# EasyEDA Pro project ProProject_大疆无人机PSDK开发板_2026-03-01.epro, board PSDK_STM32
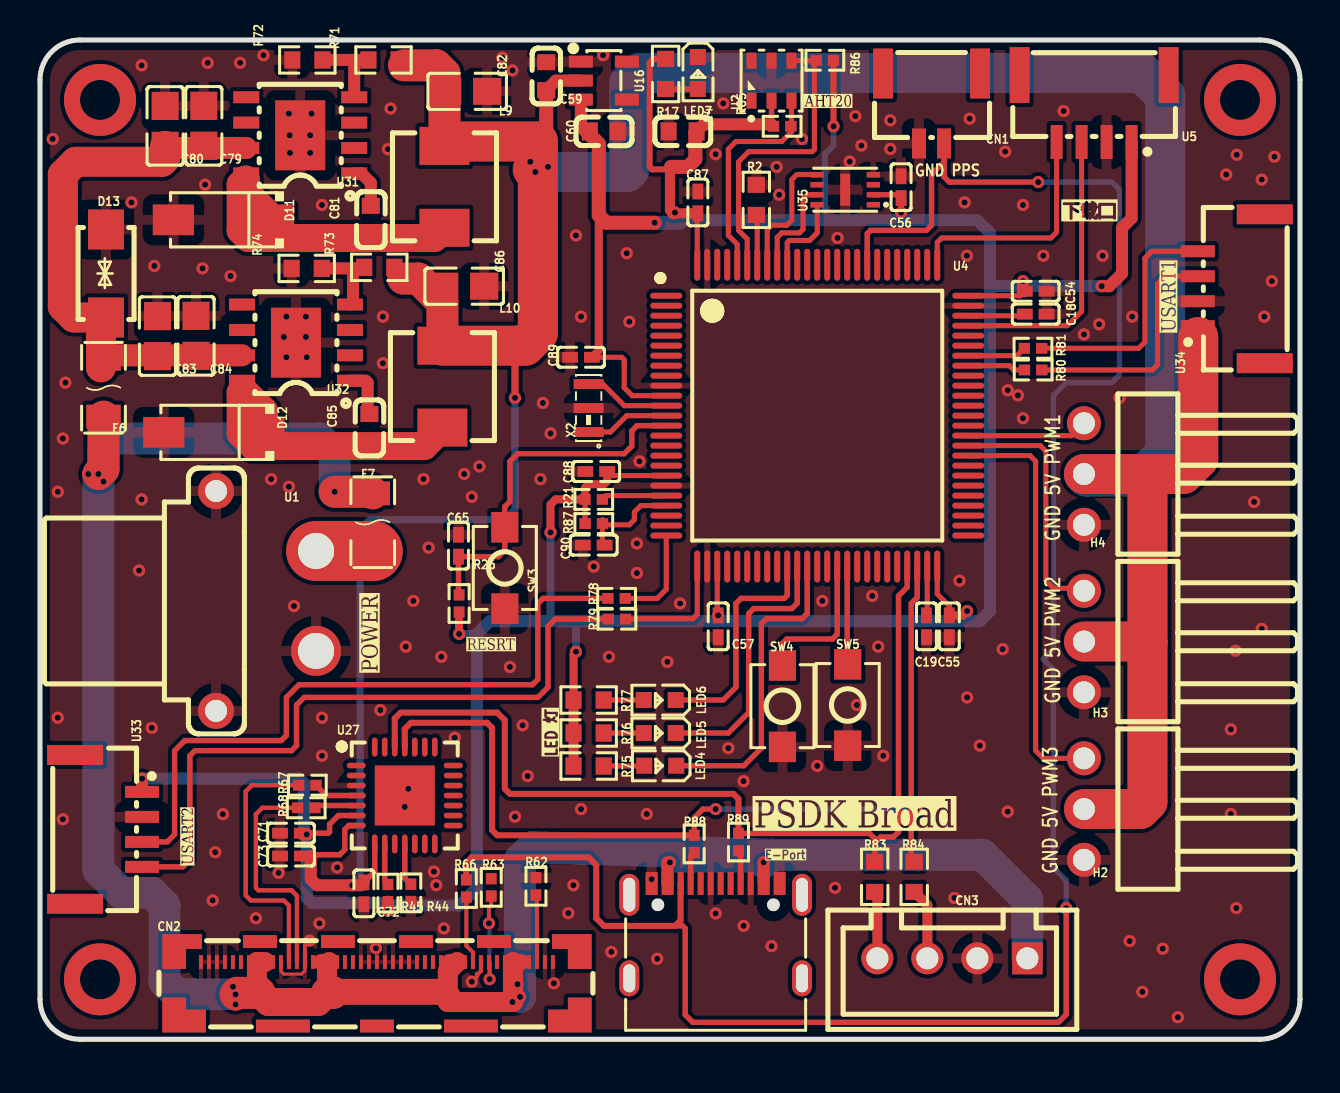
[diagram p1: board, top side]
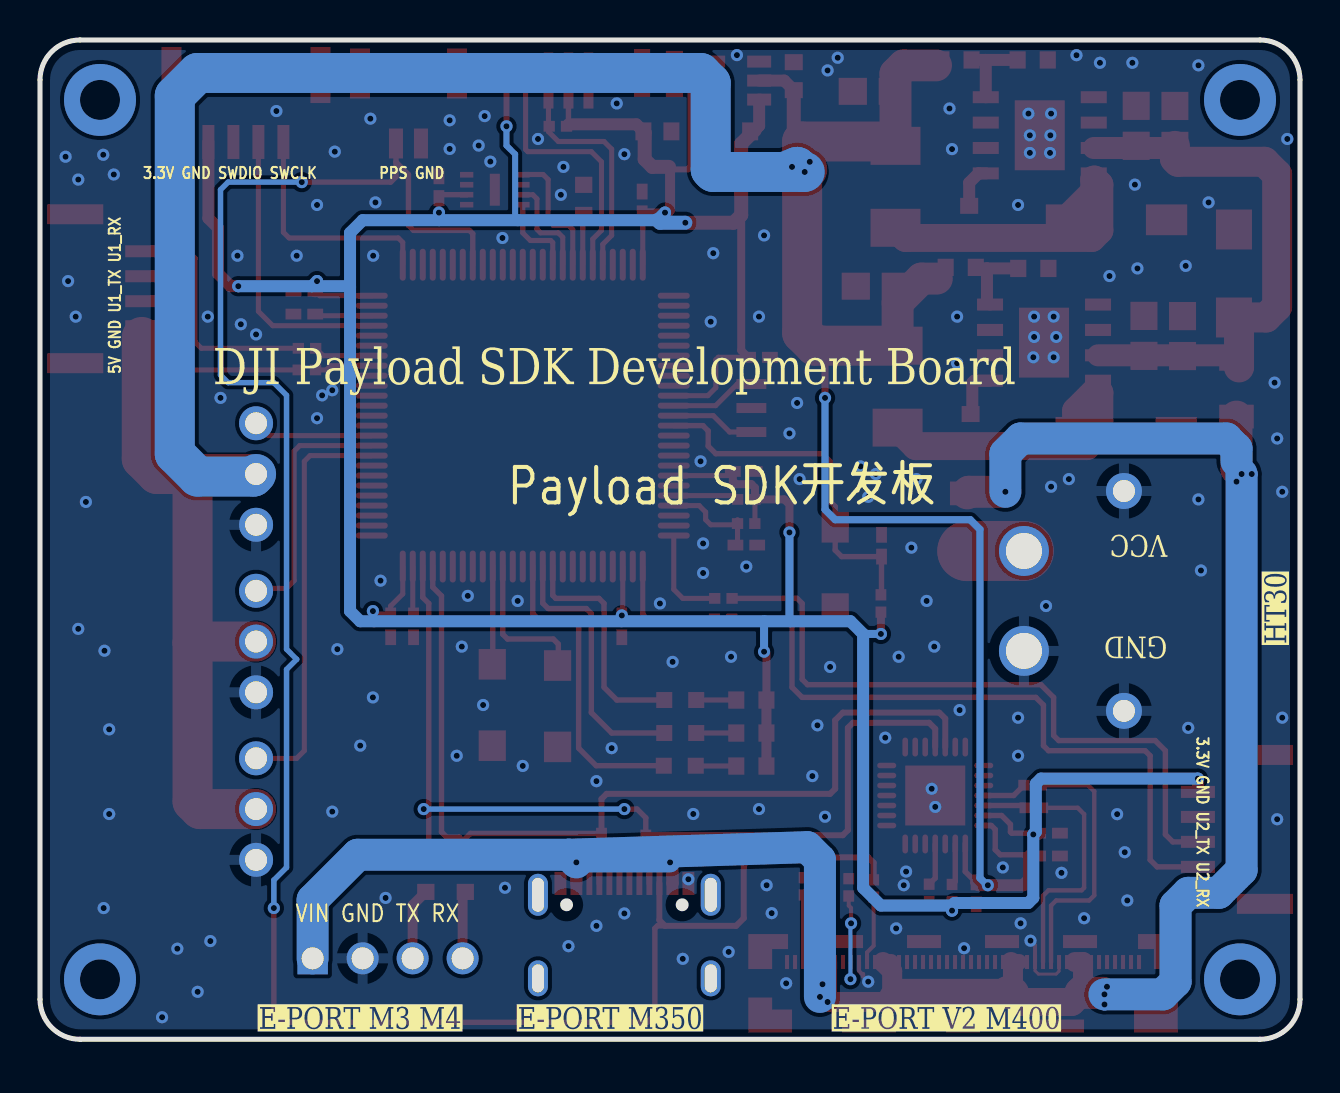
[diagram p2: board, bottom side, seen from below]

Outline 63 x 50 mm; copper layers: Top Layer, Bottom Layer. Coordinates in mm from the lower left corner of the outline.
Outline path: 0,48 0,2 arc(0.59,0.59) 2,0 61,0 arc(62.41,0.59) 63,2 63,48 arc(62.41,49.41) 61,50 2,50 arc(0.59,49.41) 0,48
Stack: Top Layer 0.035mm / Dielectric1 1.51mm FR4 er 4.5 / Bottom Layer 0.035mm

## Design rules (mm)
template: 自定义配置
spacing copperThickness1oz (default): track to track 0.102, other pairs 0.152 to 0.3
spacing copperThickness2oz: track to track 0.203, other pairs 0.152 to 0.3
track width copperThickness1oz (default): min 0.127, default 0.254, max 5
track width copperThickness2oz: min 0.203, default 0.254, max 2.54
differential pair differentialPair (default): width min 0.127, default 0.254, max 2.54; gap min 0.152, default 0.152
via viaSize (default): diameter min 0.5, default 0.61, max 10; hole min 0.3, default 0.305, max 6.3

## Placement (name value [footprint] x y rotation side)
C4  10uF  [C0603]  32.13 45.43 180 top
C18  2.2uF  [C0402]  49.78 36.28 0 top
C19  2.2uF  [C0402]  44.32 20.66 90 top
C54  100nF  [C0402]  49.78 37.43 180 top
C55  100nF  [C0402]  45.47 20.66 90 top
C56  100nF  [C0402]  43.05 42.63 270 top
C57  100nF  [C0402]  33.91 20.66 90 top
C59  100nF  [C0603]  25.31 48.19 270 top
C60  100nF  [C0603]  28.19 45.43 180 top
C65  100nF  [C0402]  20.92 24.7 270 top
C71  10uF  [C0402]  12.55 10.31 0 top
C72  10uF  [C0402]  16.19 7.3 90 top
C73  100nF  [C0402]  12.55 9.17 0 top
C79  4.7uF  [C0805]  8.19 45.7 270 top
C80  10uF  [C0805]  6.25 45.7 270 top
C81  10nF  [C0603]  16.54 41 270 top
C82  22uF  [C0805]  21.36 47.43 180 top
C83  4.7uF  [C0805]  5.87 35.18 270 top
C84  10uF  [C0805]  7.8 35.19 270 top
C85  10nF  [C0603]  16.47 30.58 270 top
C86  22uF  [C0805]  21.21 37.68 180 top
C87  100nF  [C0402]  32.89 41.87 270 top
C88  100nF  [C0402]  27.81 28.41 0 top
C89  100nF  [C0402]  27.05 34.12 0 top
C90  100nF  [C0402]  27.69 24.73 0 top
CN1  SH-GH1.25-2PLB  [CONN-SMD_2P-P1.25_SHOUHAN_1.25-2PLTDK]  44.58 46.57 180 top
CN2  DF36A-45S-0.4V(51)  [CONN-SMD_45P-P0.40_DF36A-45S-0.4V]  16.85 2.78 0 top
CN3  ZX-XH2.54-4PZZ  [CONN-TH_4P-P2.50_4PIN]  45.62 4.05 180 top
D11  SS54  [SMA_L4.4-W2.8-LS5.4-R-RD]  9.18 41 180 top
D12  SS54  [SMA_L4.4-W2.8-LS5.4-R-RD]  8.69 30.37 180 top
D13  SMAJ30CA  [SMA_L4.4-W2.8-LS5.1-BI]  3.3 38.32 270 top
E-Port  -  [PSDK-SMD]  33.78 5.42 0 top
F6  SMD1206-500-6V  [F1206]  3.17 32.6 90 top
F7  SMD1206-500-6V  [F1206]  16.64 25.87 270 top
H2  HX PZ2.54-1x3P WZ  [HDR-TH_3P-P2.54-H-M-W10.4-N]  52.2 11.52 90 top
H3  HX PZ2.54-1x3P WZ  [HDR-TH_3P-P2.54-H-M-W10.4-N]  52.2 19.9 90 top
H4  HX PZ2.54-1x3P WZ  [HDR-TH_3P-P2.54-H-M-W10.4-N]  52.2 28.28 90 top
L9  10uH  [IND-SMD_L5.4-W5.2_FXL0530]  20.22 42.65 270 top
L10  10uH  [IND-SMD_L5.4-W5.2_FXL0530]  20.12 32.65 270 top
LED4  LTST-C190KSKT  [LED0603-RD]  31.01 13.69 180 top
LED5  LTST-C190KSKT  [LED0603-RD]  30.99 15.33 180 top
LED6  LTST-C190KSKT  [LED0603-RD]  30.99 16.98 180 top
LED7  LTST-C190KSKT  [LED0603-RD]  32.89 48.35 270 top
R2  10kΩ  [R0603]  35.81 42 90 top
R17  510Ω  [R0603]  31.28 48.3 270 top
R21  10kΩ  [R0402]  27.69 27.01 0 top
R26  10kΩ  [R0402]  20.96 21.81 270 top
R44  4.7kΩ  [R0402]  18.54 7.33 90 top
R45  4.7kΩ  [R0402]  17.4 7.31 90 top
R62  0Ω  [R0402]  24.8 7.66 270 top
R63  0Ω  [R0402]  22.56 7.6 270 top
R66  0Ω  [R0402]  21.32 7.54 270 top
R67  22Ω  [R0402]  13.37 12.71 180 top
R68  22Ω  [R0402]  13.31 11.58 180 top
R71  10kΩ  [R0603]  17.18 49 0 top
R72  3.24kΩ  [R0603]  13.37 49 0 top
R73  10kΩ  [R0603]  16.96 38.62 0 top
R74  3.24kΩ  [R0603]  13.34 38.57 0 top
R75  1kΩ  [R0603]  27.43 13.67 0 top
R76  1kΩ  [R0603]  27.43 15.33 0 top
R77  1kΩ  [R0603]  27.43 16.98 0 top
R78  22Ω  [R0402]  28.83 22.06 180 top
R79  22Ω  [R0402]  28.85 21.02 180 top
R80  22Ω  [R0402]  49.66 33.49 0 top
R81  22Ω  [R0402]  49.65 34.57 0 top
R83  22Ω  [R0603]  41.74 8.13 270 top
R84  22Ω  [R0603]  43.71 8.13 270 top
R85  10kΩ  [R0402]  37.11 45.68 180 top
R86  10kΩ  [R0402]  39.24 48.98 0 top
R87  0Ω  [R0402]  27.69 25.8 0 top
R88  22Ω  [R0402]  32.71 9.78 90 top
R89  22Ω  [R0402]  34.93 9.87 90 top
SW3  HX 3x4x2-2P-2.5N  [SW-SMD_L4.0-W2.9-LS5.0]  23.24 23.58 90 top
SW4  HX 3x4x2-2P-2.5N  [SW-SMD_L4.0-W2.9-LS5.0]  37.12 16.67 90 top
SW5  HX 3x4x2-2P-2.5N  [SW-SMD_L4.0-W2.9-LS5.0]  40.39 16.73 90 top
U1  XT30PW-F  [CONN-TH_XT30PW-F]  11.3 21.93 270 top
U2  AHT20  [SENSOR-SMD_L3.0-W3.0-P1.00-BR]  36.58 47.97 270 top
U4  STM32F407VGT6  [LQFP-100_L14.0-W14.0-P0.50-LS16.0-BL]  38.86 31.2 270 top
U5  WAFER-GH1.25-4PLB  [CONN-SMD_4P-P1.25_XUNPU_WAFER-GH1.25-4PLB]  52.71 46.57 180 top
U16  TPTLV70433DBVR  [SOT-23-5_L3.0-W1.6-P0.95-LS2.8-BR]  28.19 47.97 180 top
U27  CP2102-GM  [qfn-28_l5.0-w5.0-p0.50-tl-ep3.2]  18.24 12.2 0 top
U31  TPS5430DDAR  [ESOP-8_L4.9-W3.9-P1.27-LS6.0-TL-EP]  13.01 45.23 180 top
U32  TPS5430DDAR  [ESOP-8_L4.9-W3.9-P1.27-LS6.0-TL-EP]  12.8 34.86 180 top
U33  WAFER-GH1.25-4PLB  [CONN-SMD_4P-P1.25_XUNPU_WAFER-GH1.25-4PLB]  3.43 10.5 270 top
U34  WAFER-GH1.25-4PLB  [CONN-SMD_4P-P1.25_XUNPU_WAFER-GH1.25-4PLB]  59.56 37.55 90 top
U35  DJI_SDKCC  [dfn-8_l3.0-w2.0-p0.50-bl-ep]  40.26 42.51 90 top
X2  8MHz  [OSC-SMD_3P-L3.2-W1.3-P1.20]  27.43 31.58 90 top

## Footprints (pads in the part's own frame, mm; a bottom-side part is the same pattern mirrored in y, then rotated)
C0402
  rect 0.79x0.54 smd: 1(-0.545,0) 2(0.545,0)
C0603
  rect 0.8x0.9 smd: 1(-0.7,0) 2(0.7,0)
C0805
  rect 1.41x1.35 smd: 1(-1,0) 2(1,0)
CONN-SMD_2P-P1.25_SHOUHAN_1.25-2PLTDK
  rect 0.7x1.5 smd: 1(-0.625,1.75) 2(0.625,1.75)
  rect 1x2.5 smd: 3(2.425,-1.75) 4(-2.425,-1.75)
CONN-SMD_4P-P1.25_XUNPU_WAFER-GH1.25-4PLB
  rect 0.6x1.7 smd: 1(-1.875,1.675) 2(-0.625,1.675) 3(0.625,1.675) 4(1.875,1.675)
  rect 1x2.8 smd: 5(-3.725,-1.675) 6(3.725,-1.675)
CONN-SMD_45P-P0.40_DF36A-45S-0.4V
  rect 0.2x0.7 smd: 1(-8.8,1.089) 2(-8.4,1.089) 3(-8,1.089) 4(-7.6,1.089) 5(-7.2,1.089) 6(-6.8,1.089) 7(-6.4,1.089) 8(-6,1.089) 9(-5.6,1.089) 10(-5.2,1.089) 11(-4.8,1.089) 12(-4.4,1.089) 13(-4,1.089) 14(-3.6,1.089) 15(-3.2,1.089) 16(-2.8,1.089) 17(-2.4,1.089) 18(-2,1.089) 19(-1.6,1.089) 20(-1.2,1.089) 21(-0.8,1.089) 22(-0.4,1.089) 23(0,1.089) 24(0.4,1.089) 25(0.8,1.089) 26(1.2,1.089) 27(1.6,1.089) 28(2,1.089) 29(2.4,1.089) 30(2.8,1.089) 31(3.2,1.089) 32(3.6,1.089) 33(4,1.089) 34(4.4,1.089) 35(4.8,1.089) 36(5.2,1.089) 37(5.6,1.089) 38(6,1.089) 39(6.4,1.089) 40(6.8,1.089) 41(7.2,1.089) 42(7.6,1.089) 43(8,1.089) 44(8.4,1.089) 45(8.8,1.089)
  custom 1.985x1.75 smd: 46(-9.742,1.613) 51(9.742,1.613)
  rect 1.7x0.65 smd: 47(-5.85,2.114) 48(-1.95,2.114) 49(1.95,2.114) 50(5.85,2.114) 54(0,-2.114)
  custom 2.185x1.75 smd: 52(9.643,-1.563) 56(-9.643,-1.563)
  rect 2.7x0.65 smd: 53(4.7,-2.114) 55(-4.7,-2.114)
CONN-TH_4P-P2.50_4PIN
  rect 1.524x1.6 hole 1.1: 1(-3.75,0)
  round 1.6 hole 1.1: 2(-1.25,0) 3(1.25,0) 4(3.75,0)
CONN-TH_XT30PW-F
  round 2.5 hole 1.8: 1(-2.5,2.5) 2(2.5,2.5)
  round 1.8 hole 1.1: 3(5.5,-2.5) 4(-5.5,-2.5)
dfn-8_l3.0-w2.0-p0.50-bl-ep
  rect 0.28x0.665 smd: 1(-0.75,-1.407) 2(-0.25,-1.407) 3(0.25,-1.407) 4(0.75,-1.407) 5(0.75,1.407) 6(0.25,1.407) 7(-0.25,1.407) 8(-0.75,1.407)
  rect 1.6x0.5 smd: 9(0,0)
ESOP-8_L4.9-W3.9-P1.27-LS6.0-TL-EP
  rect 1.3x0.6 smd: 1(-2.7,1.905) 2(-2.7,0.635) 3(-2.7,-0.635) 4(-2.7,-1.905) 5(2.7,-1.905) 6(2.7,-0.635) 7(2.7,0.635) 8(2.7,1.905)
  rect 2.5x3.5 smd: 9(0,0)
F1206
  rect 1.19x1.728 smd: 1(-1.445,0) 2(1.445,0)
HDR-TH_3P-P2.54-H-M-W10.4-N
  round 1.7 hole 1.1: 1(-2.54,0) 2(0,0) 3(2.54,0)
IND-SMD_L5.4-W5.2_FXL0530
  rect 1.9x2.5 smd: 1(-2.05,0) 2(2.05,0)
LED0603-RD
  rect 0.8x0.8 smd: 1(-0.799,0) 2(0.799,0)
LQFP-100_L14.0-W14.0-P0.50-LS16.0-BL
  oval 0.3x1.6 smd: 1(-6,-7.55) 2(-5.5,-7.55) 3(-5,-7.55) 4(-4.5,-7.55) 5(-4,-7.55) 6(-3.5,-7.55) 7(-3,-7.55) 8(-2.5,-7.55) 9(-2,-7.55) 10(-1.5,-7.55) 11(-1,-7.55) 12(-0.5,-7.55) 13(0,-7.55) 14(0.5,-7.55) 15(1,-7.55) 16(1.5,-7.55) 17(2,-7.55) 18(2.5,-7.55) 19(3,-7.55) 20(3.5,-7.55) 21(4,-7.55) 22(4.5,-7.55) 23(5,-7.55) 24(5.5,-7.55) 25(6,-7.55) 51(6,7.55) 52(5.5,7.55) 53(5,7.55) 54(4.5,7.55) 55(4,7.55) 56(3.5,7.55) 57(3,7.55) 58(2.5,7.55) 59(2,7.55) 60(1.5,7.55) 61(1,7.55) 62(0.5,7.55) 63(0,7.55) 64(-0.5,7.55) 65(-1,7.55) 66(-1.5,7.55) 67(-2,7.55) 68(-2.5,7.55) 69(-3,7.55) 70(-3.5,7.55) 71(-4,7.55) 72(-4.5,7.55) 73(-5,7.55) 74(-5.5,7.55) 75(-6,7.55)
  oval 1.6x0.3 smd: 26(7.55,-6) 27(7.55,-5.5) 28(7.55,-5) 29(7.55,-4.5) 30(7.55,-4) 31(7.55,-3.5) 32(7.55,-3) 33(7.55,-2.5) 34(7.55,-2) 35(7.55,-1.5) 36(7.55,-1) 37(7.55,-0.5) 38(7.55,0) 39(7.55,0.5) 40(7.55,1) 41(7.55,1.5) 42(7.55,2) 43(7.55,2.5) 44(7.55,3) 45(7.55,3.5) 46(7.55,4) 47(7.55,4.5) 48(7.55,5) 49(7.55,5.5) 50(7.55,6) 76(-7.55,6) 77(-7.55,5.5) 78(-7.55,5) 79(-7.55,4.5) 80(-7.55,4) 81(-7.55,3.5) 82(-7.55,3) 83(-7.55,2.5) 84(-7.55,2) 85(-7.55,1.5) 86(-7.55,1) 87(-7.55,0.5) 88(-7.55,0) 89(-7.55,-0.5) 90(-7.55,-1) 91(-7.55,-1.5) 92(-7.55,-2) 93(-7.55,-2.5) 94(-7.55,-3) 95(-7.55,-3.5) 96(-7.55,-4) 97(-7.55,-4.5) 98(-7.55,-5) 99(-7.55,-5.5) 100(-7.55,-6)
OSC-SMD_3P-L3.2-W1.3-P1.20
  rect 0.5x1.5 smd: 1(-1.2,0) 2(0,0) 3(1.2,0)
PSDK-SMD
  oval 1x2.1 hole 0.6x1.7: 1(-4.32,1.808) 2(4.32,1.808)
  oval 1x1.8 hole 0.6x1.4: 3(-4.32,-2.373) 4(4.32,-2.373)
  rect 0.6x1.15 smd: A1B12(-3.2,2.373) A4B9(-2.4,2.373) A9B4(2.4,2.373) A12B1(3.2,2.373)
  rect 0.3x1.15 smd: A5(-1.75,2.373) A6(-0.25,2.373) A7(0.75,2.373) A8(1.75,2.373) B5(1.25,2.373) B6(0.25,2.373) B7(-0.75,2.373) B8(-1.25,2.373)
qfn-28_l5.0-w5.0-p0.50-tl-ep3.2
  oval 0.95x0.28 smd: 1(-2.425,1.502) 2(-2.425,1.001) 3(-2.425,0.5) 4(-2.425,0) 5(-2.425,-0.5) 6(-2.425,-1) 7(-2.425,-1.501) 15(2.425,-1.501) 16(2.425,-1) 17(2.425,-0.5) 18(2.425,0) 19(2.425,0.5) 20(2.425,1.001) 21(2.425,1.502)
  oval 0.28x0.95 smd: 8(-1.502,-2.425) 9(-1.001,-2.425) 10(-0.5,-2.425) 11(0,-2.425) 12(0.5,-2.425) 13(1,-2.425) 14(1.501,-2.425) 22(1.501,2.425) 23(1,2.425) 24(0.5,2.425) 25(0,2.425) 26(-0.5,2.425) 27(-1.001,2.425) 28(-1.502,2.425)
  rect 3x3 smd: 29(0,0)
R0402
  rect 0.566x0.54 smd: 1(-0.433,0) 2(0.433,0)
R0603
  rect 0.806x0.864 smd: 1(-0.753,0) 2(0.753,0)
SENSOR-SMD_L3.0-W3.0-P1.00-BR
  rect 0.8x0.5 smd: 1(1,-1) 2(1,0) 3(1,1) 4(-1,1) 5(-1,0) 6(-1,-1)
SMA_L4.4-W2.8-LS5.1-BI
  rect 2x1.8 smd: 1(-2.2,0) 2(2.2,0)
SMA_L4.4-W2.8-LS5.4-R-RD
  rect 2.062x1.539 smd: 1(2.503,0) 2(-2.503,0)
SOT-23-5_L3.0-W1.6-P0.95-LS2.8-BR
  rect 1.2x0.6 smd: 1(1.15,-0.95) 2(1.15,0) 3(1.15,0.95) 4(-1.15,0.95) 5(-1.15,-0.95)
SW-SMD_L4.0-W2.9-LS5.0
  rect 1.53x1.36 smd: 1(-2.035,0) 2(2.035,0)

## Nets
As in the schematic.

Pads without a net: CN1 3 4; CN2 5 6 19 20 29 30 38 46 47 48 49 50 51 52 53 54 55 56; E-Port 1 2 3 4; U2 1 6; U4 1 2 3 4 5 6 7 8 9 15 16 17 18 23 24 29 30 31 32 33 34 38 39 42 43 44 45 46 51 52 53 54 55 56 57 58 62 63 64 65 66 67 70 71 77 78 79 80 81 82 84 85 86 87 88 89 90 97 98; U5 5 6; U16 4 5; U27 1 2 10 12 13 14 15 16 17 18 19 20 21 22 23 24 27 28; U31 2 3 5; U32 2 3 5; U33 5 6; U34 5 6; U35 1 3 6

## Via types
v1: diameter 3.6, hole 2, Top Layer to Bottom Layer, 4 vias
v2: diameter 0.61, hole 0.305, Top Layer to Bottom Layer, 191 vias

## Routing (per net, layer and track width the routed paths; a pad name or vN(x,y) marks a point on that pad's centre or on a via; arc(x,y) is an arc through that point)
3.3V: length 205.3
  Top Layer w0.254: U4.19 28.44,28.2 28.36,28.28 ; C54.2 49.02,37.2 U4.75 ; C55.2 45.47,21.68 44.86,22.28 U4.50 ; v2(33.91,21.21) 33.86,21.25 U4.28 ; C89.2 29.08,34.12 29.21,34 29.21,32.6 29.61,32.2 U4.11 ; U4.100 32.86,41.3 C87.2 ; R21.1 27.25,25.81 R87.1
  Top Layer w0.27: v2(43.05,41.36) C56.2 42.88,42.26 U35.2 ; C71.2 14.42,10.31 14.48,10.38 14.48,10.76 14.92,11.2 U27.6 ; R85.2 36.58,45.78 U2.2
  Top Layer w0.3: 31.5,43.59 31.42,43.52 30.61,43.52 30.48,43.65 30.48,48.86 30.68,49.05 R17.1 ; R86.2 v2(39.68,45.68)
  Top Layer w0.4: C89.2 27.94,34.47 27.94,41.24 ; v2(46.35,21.42) 46.14,21.21 C55.2 ; R26.2 v2(20.96,20.28) ; v2(26.8,19.39) 26.68,19.27 R77.1 ; C88.2 28.36,27.94 28.19,27.78 27.43,27.78 27.25,27.6 R21.1 25.78,27.01 25.53,26.76 v2(25.53,25.36)
  Top Layer w0.5: C87.2 31.66,41.33 31.5,41.49 31.5,43.59 31.55,43.65 ; R77.1 R76.1 R75.1
  Top Layer w0.6: C71.2 13.16,10.25 v2(13.34,10.25) ; v2(49.15,37.94) 49.15,37.52 C54.2 ; U5.1 54.58,41.08 54.1,40.6 54.1,38.32 53.47,37.68 v2(53.09,37.68) ; U16.3 27.04,45.7 27.27,45.48 ; R45.1 17.4,6.88 v2(17.4,6.44) ; C4.1 33.18,45.78 36.58,45.78 ; v2(31.75,41.36) 31.7,41.36 31.66,41.33 ; U33.1 v2(5.1,13.04)
  Top Layer w0.7: C4.1 32.77,45.36 32.77,44.03 32.38,43.65 31.55,43.65 ; 27.27,45.48 27.94,44.81 27.94,41.24 28.32,40.86 v2(30.73,40.86)
  Bottom Layer w0.27: v2(43.05,41.36) 43.05,40.99 43.04,40.98
  Bottom Layer w0.3: v2(39.68,45.68) 39.68,44.72 39.24,44.28 39.24,41.11 39.11,40.98
  Bottom Layer w0.4: 25.48,20.92 25.53,20.96 v2(25.53,25.36) ; v2(33.91,21.21) 33.92,21.2 33.92,20.92 ; v2(20.96,20.28) 21.84,20.28 ; 46.3,20.92 46.35,20.98 v2(46.35,21.42) ; v2(26.8,19.39) 26.8,20.91 26.79,20.92
  Bottom Layer w0.6: 47.5,37.65 47.5,40.35 46.86,40.98 32.13,40.98 v2(31.75,41.36) ; 47.5,37.65 47.53,37.68 49.4,37.68 ; 47.5,37.65 47.5,21.42 46.99,20.92 22.48,20.92 21.84,20.28 21.84,7.58 20.96,6.69 17.4,6.69 ; v2(53.09,37.68) 49.4,37.68 ; 49.4,37.68 v2(49.15,37.94) ; 17.4,6.69 v2(17.4,6.44) ; 17.4,6.69 17.27,6.82 13.59,6.82 13.34,7.07 v2(13.34,10.25) 13.21,10.38 13.21,12.79 12.95,13.04 v2(5.1,13.04)
  Bottom Layer w0.7: 32.13,40.98 32,40.86 v2(30.73,40.86)
5V: length 174.4
  Top Layer w0.27: C72.2 16.74,8.39 U27.8 ; U27.7 15.43,10.7 15.24,10.5 15.24,9.49 14.99,9.23 13.82,9.23 13.76,9.17 C73.2
  Top Layer w0.36: v2(23.75,32.09) 23.75,34.61 23.85,34.7
  Top Layer w0.6: U16.2 25.79,47.97 C59.2 ; C72.2 16.06,7.71 v2(15.61,7.71) 13.84,7.71 13.54,8.01 13.54,9.17
  Top Layer w0.7: C59.2 25.31,45.34 24.89,44.92 ; 20.44,44.92 L9.1
  Top Layer w1.6: L10.1 20.12,36.86 18.92,38.06 18.16,38.06 ; L9.1 20.22,48.32 19.81,48.73 18.2,48.73
  Top Layer w2: 55.37,19.85 55.37,28.03 55.12,28.28 ; 55.37,19.85 55.32,19.9 H3.2 ; 55.37,19.85 55.37,11.9 54.99,11.52 H2.2 ; 55.12,28.28 57.15,28.28 57.91,29.05 57.91,35.14 ; 55.12,28.28 H4.2 ; 20.44,44.92 24.89,44.92 24.89,43.52 ; 24.89,43.52 24.89,35.34 24.26,34.7 L10.1 ; 24.89,43.52 24.64,43.52
  Bottom Layer w0.36: 15.62,7.71 15.64,7.71 16,8.07 16,25.51 16.49,26 23.24,26 23.75,26.5 v2(23.75,32.09)
  Bottom Layer w2: H4.2 52.32,28.16 55.12,28.16 56.26,29.3 56.26,47.21 55.12,48.35 29.97,48.35 29.46,47.84 29.46,43.52 29.34,43.4 25.78,43.4 ; 25.78,43.4 25.15,43.65 24.89,43.4 ; 25.78,43.4 24.89,43.4 ; v2(24.76,43.4) 24.89,43.4
  vias: v2(24.51,43.9) v2(25.4,43.65)
GND: length 4.6
  Top Layer w0.15: CN2.11 12.05,3.41 12.19,3.26 13.08,3.26 13.25,3.43 CN2.14
  Top Layer w0.2: CN2.36 22.05,3.42 21.9,3.26 21.84,3.26 21.84,3.14 v2(21.59,2.88) ; v2(13.47,4.94) 13.25,4.71 CN2.14
  vias: v2(0.64,45.05) v2(0.89,27.39) v2(0.89,16.09) v2(1.14,30.06) v2(1.14,11.01) v2(1.27,32.86) v2(4.57,41.87) v2(4.95,23.46) v2(5.08,48.73) v2(5.08,27.01) v2(5.59,15.58) v2(5.72,38.7) v2(8.13,38.57) v2(8.25,42.76) v2(8.38,48.86) v2(8.64,6.95) v2(8.76,9.36) v2(9.14,11.27) v2(9.53,38.19) v2(10,48.86) v2(10.79,6.06) v2(11.18,49.24) v2(11.56,28.03) v2(11.93,8.33) v2(12.19,35.14) v2(12.32,36.16) v2(12.32,34.12) v2(12.45,46.32) v2(12.45,27.65) v2(12.48,45.23) v2(12.5,44.35) v2(12.7,21.68) v2(13.29,36.16) v2(13.29,35.14) v2(13.34,34.12) v2(13.51,45.23) v2(13.51,44.35) v2(13.58,46.32) v2(13.97,5.8) v2(14.1,41.75) v2(14.1,16.09) v2(14.1,14.19) v2(14.86,8.6) v2(16.8,4.56) v2(17.02,16.47) v2(17.15,36.16) v2(17.15,33.83) v2(17.4,44.54) v2(17.53,46.57) v2(18.24,11.63) v2(18.29,19.65) v2(18.41,12.53) v2(18.67,21.93) v2(19.18,28.03) v2(19.43,24.6) v2(19.7,8.39) v2(19.81,7.71) v2(20.07,19.14) v2(20.19,5.55) v2(20.74,15.09) v2(21.21,28.28) v2(21.59,27.14) v2(21.97,28.66) v2(23.11,49.11) v2(23.5,18.63) v2(23.62,48.48) v2(23.75,11.14) v2(24.13,15.71) v2(24.38,13.17) v2(25.02,28.03) v2(25.15,31.84) v2(25.53,30.31) v2(25.69,2.8) v2(26.42,6.31) v2(26.67,7.71) v2(26.8,40.22) v2(27.05,36.16) v2(27.05,11.52) v2(27.69,23.65) v2(28.15,49.24) v2(28.45,19.14) v2(28.57,4.37) v2(29.34,39.33) v2(29.46,35.9) v2(29.84,24.81) v2(29.84,23.33) v2(29.97,28.92) v2(30.34,11.27) v2(30.58,8.01) v2(30.86,4.03) v2(31.37,18.89) v2(32,21.81) v2(33.78,44.28) v2(33.78,6.3) v2(34.16,46.83) v2(34.42,14.57) v2(35.18,12.92) v2(35.18,5.68) v2(36.58,4.66) v2(36.83,43.65) v2(36.96,42.25) v2(38.1,45.05) v2(38.86,13.68) v2(39.12,21.93) v2(39.75,7.58) v2(39.88,40.09) v2(40.48,43.92) v2(40.77,46.19) v2(40.84,16.73) v2(41.07,44.72) v2(41.61,22.19) v2(41.91,19.65) v2(42.16,14.19) v2(42.52,45.98) v2(42.52,44.55) v2(45.72,7.07) v2(45.97,22.95) v2(46.23,41.87) v2(46.34,39.2) v2(46.35,17.11) v2(46.48,46.06) v2(46.99,14.69) v2(48.13,19.52) v2(48.26,44.41) v2(48.39,32.47) v2(48.39,11.39) v2(48.9,32.22) v2(49.15,41.75) v2(49.15,31.08) v2(50.16,39.2) v2(51.18,46.44) v2(52.2,35.27) v2(52.96,35.78) v2(53.13,39.2) v2(53.97,32.09) v2(54.48,4.92) v2(54.61,36.16) v2(55.12,2.38) v2(56.13,4.53) v2(56.9,1.1) v2(59.31,43.27) v2(59.54,15.51) v2(59.54,11.27) v2(59.84,44.26) v2(59.78,19.44) v2(59.82,6.57) v2(60.71,26.89) v2(61.09,43.02) v2(61.09,20.54) v2(61.21,36.16) v2(61.59,37.94) v2(61.72,44.16)
VCC: length 119
  Top Layer w0.6: v2(31.5,8.85) 31.37,8.85 31.37,7.81 E-Port.A4B9 ; E-Port.A9B4 v2(36.18,8.85)
  Top Layer w0.8: CN2.16 CN2.17 ; CN2.32 CN2.33 ; CN2.40 CN2.41
  Top Layer w1: CN2.17 14.35,3.77 14.35,2.21 ; 10.85,2.45 CN2.8 CN2.9 ; 14.35,2.21 14.35,2.12 ; 14.35,2.21 14.17,2.15 ; 14.35,2.21 14.66,2.32 ; CN2.33 20.39,3.41 20.39,1.87 23.65,1.87 CN2.40
  Top Layer w1.3: 14.6,2.38 20.15,2.38 20.39,2.13
  Top Layer w1.4: 10.97,2.32 11.43,1.87 13.89,1.87 14.35,2.32
  Top Layer w1.6: v2(14.73,27.39) 16.56,27.39 F7.1 ; v2(9.78,2.25) 9.86,2.32 10.97,2.32 10.85,2.45 ; 14.6,2.38 14.66,2.32 14.35,2.32 ; F6.1 3.17,28.54 v2(2.92,28.28)
  Bottom Layer w1: v2(36.18,8.85) v2(31.5,8.85)
  Bottom Layer w1.6: v2(9.78,2.25) 6.86,2.25 6.22,2.88 6.22,6.69 5.59,7.33 4.06,7.33 2.92,8.47 v2(2.92,28.28) ; 36.58,9.23 24.64,9.61 24,8.98 v2(24,2.12) ; 36.58,9.23 36.56,9.23 v2(36.18,8.85) ; 36.58,9.23 47.12,9.23 49.37,6.98 CN3.1 ; v2(14.73,27.39) 14.73,29.3 13.97,30.06 3.68,30.06 3.17,29.55 3.17,28.92
  vias: v2(2.41,28.28) v2(3.17,27.9) v2(9.65,2.63) v2(9.78,1.74) v2(23.62,1.87) v2(23.88,2.76)
VDDA: length 5.1
  Top Layer w0.254: 28.12,26 28.12,25.92 28.3,25.74 29.46,25.74 29.72,26 29.72,26.38 30.04,26.7 U4.22 ; R87.2 28.12,24.83 C90.2
VIN: length 28.8
  Top Layer w1.1: U31.7 6.36,44.6 C80.2 ; U32.7 3.35,34.22 F6.2
  Top Layer w1.5: 3.05,33.62 3.05,35.86 D13.2 1.69,36.12 1.14,36.67 1.14,43.27 1.78,43.9 6.1,43.9 6.25,44.06 C80.2
(no net):
  vias: v1(3,47) v1(3,3) v1(60,47) v1(60,3)
IIC_NRST: length 4.2
  Top Layer w0.254: U4.91 37.36,39.86 37.47,39.97 38.48,39.97 38.86,40.35 38.86,41.75 U35.8
IIC_SCL: length 5.1
  Top Layer w0.254: U35.7 38.36,42.26 38.15,42.05 38.15,40.53 37.97,40.35 37.08,40.35 36.86,40.13 U4.92
IIC_SDA: length 6.6
  Top Layer w0.254: U35.5 38.84,43.27 37.85,43.27 37.59,43.02 37.59,40.98 37.34,40.73 36.58,40.73 36.36,40.52 U4.93
KEY1: length 7.5
  Top Layer w0.27: U4.40 39.86,20.27 39.62,20.03 37.34,20.03 37.08,19.77 37.08,18.74 SW4.2
KEY2: length 4.9
  Top Layer w0.27: SW5.2 40.36,18.78 U4.41
LED1: length 15.7
  Top Layer w0.27: U4.37 38.36,21.31 38.1,21.04 36.32,21.04 36.07,20.79 36.07,14.57 35.19,13.69 LED4.1
LED2: length 13.5
  Top Layer w0.27: LED5.1 34.41,15.33 35.43,16.34 35.43,21.3 35.69,21.55 37.59,21.55 37.86,21.82 U4.36
LED3: length 11.6
  Top Layer w0.27: LED6.1 34.16,16.98 34.8,17.61 34.8,21.81 35.05,22.06 37.21,22.06 37.36,22.21 U4.35
PPS: length 104.6
  Top Layer w0.27: U4.83 41.36,40.31 41.53,40.47 44.32,40.47 44.58,40.73 44.58,43.27 45.2,43.89 ; 45.2,43.89 45.2,43.15 45.47,42.89 v2(49.91,42.89) ; 45.2,43.89 CN1.1 ; 31.75,5.68 32.13,5.68 32.26,5.55 32.26,1.23 32.64,0.85 50.93,0.85 51.31,1.23 v2(51.31,6.57)
  Top Layer w0.3: E-Port.A5 32.03,5.96 31.75,5.68 28.19,5.68 27.81,6.06 27.81,8.72 27.43,9.11 21.59,9.11 21.32,8.83 R66.1
  Bottom Layer w0.27: v2(51.31,6.57) 51.31,7.96 50.67,8.6 50.67,18.5 50.16,19.01 50.67,19.52 50.67,32.22 51.31,32.86 53.59,32.86 53.97,33.24 53.97,42.51 53.59,42.89 v2(49.91,42.89)
PWM1: length 20.5
  Top Layer w0.254: H2.3 50.16,14.06 49.78,14.44 49.78,28.92 49.5,29.2 U4.59
PWM2: length 12.6
  Top Layer w0.254: U4.60 50.01,29.7 50.29,29.43 50.29,22.95 50.67,22.57 52.07,22.57 H3.3
PWM3: length 6
  Top Layer w0.254: H4.3 51.58,30.2 U4.61
RST: length 17.9
  Top Layer w0.27: U4.14 29.85,30.7 29.59,30.44 29.59,29.68 29.21,29.3 23.88,29.3 23.5,28.92 23.5,26.91 23.24,26.65 SW3.2 23.24,24.47 22.92,24.15 C65.2 20.92,22.27 R26.1
SCL: length 11
  Top Layer w0.254: U4.96 34.86,39.78 34.42,40.22 34.42,44.54 34.8,44.92 37.08,44.92 37.58,45.41 U2.3
SDA: length 15.1
  Top Layer w0.254: 38.79,48.97 R86.1 ; 38.79,48.97 U2.4 ; 38.79,48.97 38.72,48.89 38.72,44.52 38.61,44.41 35.43,44.41 34.93,43.9 34.93,40.47 35.36,40.04 U4.95
SWCLK: length 11.8
  Top Layer w0.254: U4.76 44.86,39.87 45.09,40.09 50.55,40.09 50.83,40.38 U5.4
SWDIO: length 14.4
  Top Layer w0.254: U4.72 51.36,35.7 52.08,36.42 U5.3
USART1_RX: length 3
  Top Layer w0.254: U4.69 48.85,34.2 R81.1
USART1_TX: length 2.9
  Top Layer w0.254: U4.68 48.47,33.7 48.69,33.49 R80.1
USART2_RX: length 6.1
  Top Layer w0.254: U4.26 32.86,21.27 32.64,21.04 29.84,21.04 29.82,21.02 R79.1
USART2_TX: length 4.9
  Top Layer w0.254: U4.25 31.31,22.51 30.86,22.06 R78.1
USART3_RX: length 47.2
  Top Layer w0.27: 41.74,9.82 R83.1 ; 41.74,9.82 41.74,10.04 41.48,10.3 R89.2 ; 41.74,9.82 42.04,10.12 42.67,10.12 42.93,10.38 42.93,22.19 43.36,22.62 U4.47
  Top Layer w0.3: 17.74,14.62 17.74,16.05 18.03,16.34 22.86,16.34 23.24,15.96 23.24,12.53 23.5,12.28 34.67,12.28 34.93,12.03 R89.2
USART3_TX: length 48.2
  Top Layer w0.27: 43.56,11.55 43.56,9.03 R84.1 ; 43.56,11.55 43.6,11.52 v2(43.81,11.52) ; 43.56,11.55 43.56,21.81 43.86,22.11 U4.48 ; R88.2 32.71,11.08 33.15,11.52 v2(33.78,11.52)
  Top Layer w0.3: 18.24,14.62 18.24,15.53 18.54,15.84 22.35,15.84 22.61,15.58 22.61,10.46 22.86,10.21 R88.2
  Bottom Layer w0.27: v2(33.78,11.52) v2(43.81,11.52)
USB_DM: length 2.1
  Top Layer w0.27: U27.5 13.86,11.7 13.74,11.58
USB_DP: length 2.2
  Top Layer w0.27: R67.1 14.32,12.2 U27.4
XTAL1: length 4.2
  Top Layer w0.254: U4.13 29.34,31.2 28.52,30.39 X2.1
XTAL2: length 4.3
  Top Layer w0.254: U4.12 29.22,31.7 28.14,32.78 X2.3
$1N1193: length 1.6
  Top Layer w0.27: E-Port.B8 32.53,9.17 R88.1
$1N1196: length 1.7
  Top Layer w0.27: 34.93,9.44 35.03,9.33 E-Port.B5
$1N5067: length 2.5
  Top Layer w0.254: R2.1 35.86,41.2 U4.94
$1N50893: length 2.9
  Top Layer w0.254: C18.1 49.16,36.2 U4.73
$1N50929: length 2.5
  Top Layer w0.254: U4.49 44.36,21.25 C19.2
$1N51439: length 3.3
  Top Layer w0.254: U4.21 28.31,27.2 R21.2
$1N51857: length 2.2
  Top Layer w0.6: U31.1 16.07,43.33 16.54,42.86 16.54,41.7
$1N51860: length 4.2
  Top Layer w0.6: U31.4 15.71,49 15.72,49 ; 15.72,49 R71.1 ; 15.72,49 R72.2
$1N51861: length 15.8
  Top Layer w1.4: L9.2 19.72,40.09 10.41,40.09 10.03,40.47 10.03,42.76 10.29,43.02 10.29,42.39 D11.2
$1N52286: length 2.5
  Top Layer w0.6: U32.1 16.29,32.95 16.38,32.86 16.38,31.37 C85.1
$1N52289: length 4
  Top Layer w0.6: R74.2 15.65,38.57 ; 15.65,38.57 15.65,36.92 U32.4 ; 15.65,38.57 16.16,38.57 R73.1
$1N52290: length 15.5
  Top Layer w1.4: D12.2 11.19,31.44 10.16,32.47 10.03,32.35 10.03,30.31 10.67,29.68 19.2,29.68 L10.2
$1N52830: length 2
  Top Layer w0.254: LED4.2 30.2,13.67 R75.2
$1N52831: length 2
  Top Layer w0.254: R76.2 LED5.2
$1N52832: length 2
  Top Layer w0.254: R77.2 LED6.2
$1N53330: length 34.1
  Top Layer w0.27: R78.2 25.15,22.06 24.89,21.81 24.89,18.01 24.62,17.74 12.95,17.74 12.32,17.11 12.32,15.2 12.06,14.95 7.24,14.95 6.73,14.44 6.73,10.25 6.36,9.88 U33.3
$1N53334: length 34.5
  Top Layer w0.27: U33.4 7.14,8.63 7.49,8.98 7.49,14.19 7.75,14.44 12.57,14.44 12.83,14.69 12.83,16.73 13.21,17.11 24.89,17.11 25.4,17.61 25.4,20.66 25.76,21.02 28.41,21.02
$1N53516: length 12.1
  Top Layer w0.254: R80.2 55.63,33.49 55.88,33.74 55.88,37.81 56.25,38.18 U34.3
$1N53518: length 12.3
  Top Layer w0.254: U34.4 55.6,39.43 55.25,39.08 55.25,34.89 54.93,34.57 R81.2
$1N55427: length 2.1
  Top Layer w0.27: R45.2 17.24,7.91 U27.9
$1N55429: length 2.1
  Top Layer w0.27: 18.54,7.76 18.24,8.06 U27.11
$1N56036: length 3.4
  Top Layer w0.2: CN2.43 24.85,7.17 R62.2
$1N56037: length 5.1
  Top Layer w0.2: v2(22.48,3.01) 22.48,3.83 CN2.37 ; R63.2 22.56,6.69 22.45,6.57 v2(22.45,5.8)
  Bottom Layer w0.2: v2(22.48,3.01) 22.48,5.77 v2(22.45,5.8)
$1N56045: length 3.4
  Top Layer w0.2: R66.2 21.32,4.68 21.65,4.35 CN2.35
$1N56047: length 13.2
  Top Layer w0.22: CN2.12 12.45,6.69 12.19,6.95 10.54,6.95 10.29,7.2 10.29,12.41 10.59,12.71 R67.2
$1N56048: length 11.4
  Top Layer w0.22: CN2.13 12.85,7.18 12.57,7.45 10.92,7.45 10.79,7.58 10.79,11.27 11.11,11.58 R68.2
$1N56278: length 3.6
  Top Layer w0.5: CN3.3 44.37,6.72 R84.2
$1N56282: length 3.4
  Top Layer w0.5: R83.2 41.87,7.24 CN3.4
$1N56811: length 1.6
  Top Layer w0.27: R17.2 32.89,47.55 LED7.2
$1N56916: length 2.8
  Top Layer w3: 16.64,24.42 16.63,24.43 U1.1

## Copper pours and planes (outline as drawn; the poured copper is in the pictures)
GND on Top Layer: -4.06,53.81 67.06,53.81 67.06,-3.59 -4.06,-3.59
GND on Bottom Layer: -4.44,54.7 66.53,54.7 66.53,-3.59 -4.44,-3.59

## Text on the board
Bottom Silkscreen Layer: 5V GND U1_TX U1_RX | PPS GND | 3.3V GND SWDIO SWCLK | 3.3V GND U2_TX U2_RX | VIN GND TX RX | HT30 | E-PORT V2 M400 | E-PORT M350 | E-PORT M3 M4 | VCC | GND | DJI Payload SDK Development Board | Payload SDK开发板
Top Silkscreen Layer: GND PPS | GND 5V PWM3 | GND 5V PWM1 | GND 5V PWM2 | RESRT | USART2 | LED 灯 | AHT20 | USART1 | 下载口 | POWER | PSDK Broad
